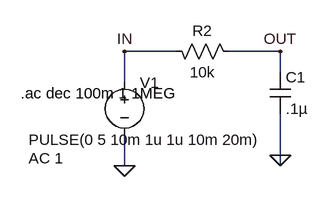
[diagram p0: schematic AC_RC_filter.asc]
AC_RC_filter.asc, the LTspice schematic file:
Version 4
SHEET 1 880 680
WIRE 144 112 64 112
WIRE 304 112 224 112
WIRE 304 144 304 112
WIRE 64 160 64 112
WIRE 304 272 304 208
WIRE 64 288 64 240
WIRE 304 288 304 272
FLAG 64 288 0
FLAG 304 272 0
FLAG 64 112 IN
FLAG 304 112 OUT
SYMBOL voltage 64 144 R0
WINDOW 3 -148 104 Left 2
WINDOW 123 -148 132 Left 2
WINDOW 39 0 0 Left 0
SYMATTR InstName V1
SYMATTR Value PULSE(0 5 10m 1u 1u 10m 20m)
SYMATTR Value2 AC 1
SYMBOL cap 288 144 R0
SYMATTR InstName C1
SYMATTR Value .1µ
SYMBOL res 128 96 M90
WINDOW 0 0 56 VBottom 2
WINDOW 3 32 56 VTop 2
SYMATTR InstName R2
SYMATTR Value 10k
TEXT -96 176 Left 2 !.ac dec 100m 1 1MEG

The netlist it stands for:
* AC_RC_filter.asc
V1 IN 0 PULSE(0 5 10m 1u 1u 10m 20m) AC 1
C1 OUT 0 .1µ
R2 IN OUT 10k
.ac dec 100m 1 1MEG
.backanno
.end